# Altium project 60ghz radar pcb.PrjPcb
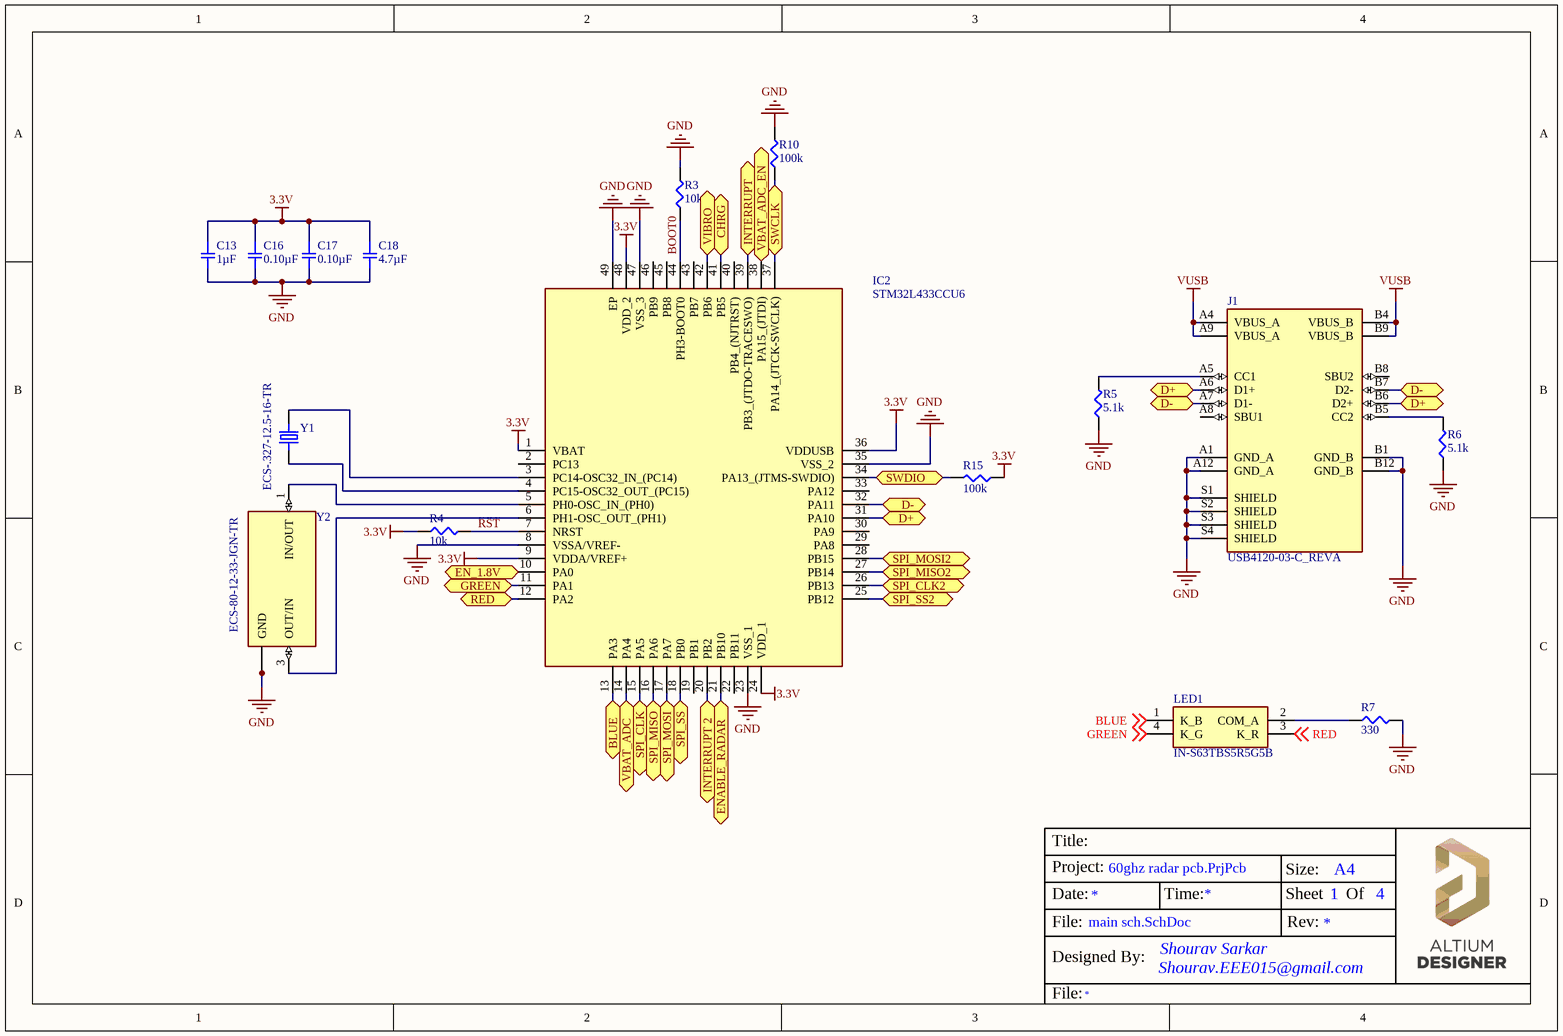
[diagram p0: main sch.SchDoc]
4 sheets, 51 parts. Net scope: flat (ports and power ports of the same name join across sheets).
Board file: 60ghz radar pcb.PcbDoc
Sheets:
  main sch.SchDoc
  power schematic.SchDoc
  radar sch.SchDoc
  battery check and motor.SchDoc

## Sheet main sch.SchDoc
size A4; SheetNumber: 1; SheetTotal: 4

### Parts
C13  1µF  [SMD-0402C]
C16  0.10µF  [SMD-0402C]
C17  0.10µF  [SMD-0402C]
C18  4.7µF  [SMD-0402C]
IC2  STM32L433CCU6  [QFN50P700X700X60-49N-D]
J1  USB4120-03-C_REVA  [GCT_USB4120-03-C_REVA]
LED1  IN-S63TBS5R5G5B  [INS63TBS5R5G5B]
R3  10k  [SMD-0402-RES]
R4  10k  [SMD-0402-RES]
R5  5.1k  [SMD-0402-RES]
R6  5.1k  [SMD-0402-RES]
R7  330  [SMD-0402-RES]
R10  100k  [SMD-0402-RES]
R15  100k  [SMD-0402-RES]
Y1  ECS-.327-12.5-16-TR  [XTAL_ECS-.327-12.5-16-TR]
Y2  ECS-80-12-33-JGN-TR  [XTAL_ECS-240-8-33-AGN-TR]

### Ports
BLUE (bidir), CHRG (bidir), D+ (bidir), D- (bidir), EN_1.8V (bidir), ENABLE_RADAR (bidir), GREEN (bidir), INTERRUPT 2 (bidir), INTERRUPT (bidir), RED (bidir), SPI_CLK2 (bidir), SPI_CLK (bidir), SPI_MISO2 (bidir), SPI_MISO (bidir), SPI_MOSI2 (bidir), SPI_MOSI (bidir), SPI_SS2 (bidir), SPI_SS (bidir), SWCLK (bidir), SWDIO (bidir), VBAT_ADC (bidir), VBAT_ADC_EN (bidir), VIBRO (bidir)

### Nets
3.3V: C13.1 C16.1 C17.1 C18.1 IC2.1(VBAT) IC2.9(VDDA/VREF+) IC2.24(VDD_1) IC2.36(VDDUSB) IC2.48(VDD_2) R4.1 R15.1
GND: C13.2 C16.2 C17.2 C18.2 IC2.8(VSSA/VREF-) IC2.23(VSS_1) IC2.35(VSS_2) IC2.47(VSS_3) IC2.49(EP) J1.A1(GND_A) J1.A12(GND_A) J1.B1(GND_B) J1.B12(GND_B) J1.S1(SHIELD) J1.S2(SHIELD) J1.S3(SHIELD) J1.S4(SHIELD) R3.2 R5.1 R6.1 R7.2 R10.2 Y2.2(GND) Y2.4(GND)
VUSB: J1.A4(VBUS_A) J1.A9(VBUS_A) J1.B4(VBUS_B) J1.B9(VBUS_B)
BLUE: IC2.13(PA3) ; port BLUE
BLUE: LED1.1(K_B) ; off-sheet BLUE  [a separate net that carries the same name]
BOOT0: IC2.44(PH3-BOOT0) R3.1
CHRG: IC2.41(PB5) ; port CHRG
D+: IC2.31(PA10) J1.A6(D1+) J1.B6(D2+) ; port D+
D-: IC2.32(PA11) J1.A7(D1-) J1.B7(D2-) ; port D-
EN_1.8V: IC2.10(PA0) ; port EN_1.8V
ENABLE_RADAR: IC2.21(PB10) ; port ENABLE_RADAR
GREEN: IC2.11(PA1) ; port GREEN
GREEN: LED1.4(K_G) ; off-sheet GREEN  [a separate net that carries the same name]
INTERRUPT: IC2.39(PB3_(JTDO-TRACESWO)) ; port INTERRUPT
INTERRUPT 2: IC2.20(PB2) ; port INTERRUPT 2
RED: IC2.12(PA2) ; port RED
RED: LED1.3(K_R) ; off-sheet RED  [a separate net that carries the same name]
RST: IC2.7(NRST) R4.2
SPI_CLK: IC2.15(PA5) ; port SPI_CLK
SPI_CLK2: IC2.26(PB13) ; port SPI_CLK2
SPI_MISO: IC2.16(PA6) ; port SPI_MISO
SPI_MISO2: IC2.27(PB14) ; port SPI_MISO2
SPI_MOSI: IC2.17(PA7) ; port SPI_MOSI
SPI_MOSI2: IC2.28(PB15) ; port SPI_MOSI2
SPI_SS: IC2.18(PB0) ; port SPI_SS
SPI_SS2: IC2.25(PB12) ; port SPI_SS2
SWCLK: IC2.37(PA14_(JTCK-SWCLK)) R10.1 ; port SWCLK
SWDIO: IC2.34(PA13_(JTMS-SWDIO)) R15.2 ; port SWDIO
VBAT_ADC: IC2.14(PA4) ; port VBAT_ADC
VIBRO: IC2.42(PB6) ; port VIBRO
NetIC2_3: IC2.3(PC14-OSC32_IN_(PC14)) Y1.1
NetIC2_4: IC2.4(PC15-OSC32_OUT_(PC15)) Y1.2
NetIC2_5: IC2.5(PH0-OSC_IN_(PH0)) Y2.1(IN/OUT)
NetIC2_6: IC2.6(PH1-OSC_OUT_(PH1)) Y2.3(OUT/IN)
NetJ1_A5: J1.A5(CC1) R5.2
NetJ1_B5: J1.B5(CC2) R6.2
NetLED1_2: LED1.2(COM_A) R7.1

Not connected (* = marked no-connect by the designer): IC2 2(PC13) 19(PB1) 22(PB11) 29(PA8) 30(PA9) 33(PA12) 38(PA15_(JTDI)) 40(PB4_(NJTRST)) 43(PB7) 45(PB8) 46(PB9); J1 A8(SBU1) B8(SBU2)

### Notes on the sheet
- Title:
- Project:
- Date:
- Time:
- Sheet
- Size:
- A4
- Of
- Designed By:
- File:
- Shourav.EEE015@gmail.com
- Shourav Sarkar
- Rev:

### Library data of the parts
C13 = GCM155C71A105KE38D: CAP CER 1UF 10V X7S 0402; Manufacturer: Murata Electronics North America; Factory Stock: 0; Unit Price (USD): 0.12; Minimum Quantity: 1; Tolerance: ±10%; Datasheets: http://www.murata.com/~/media/webrenewal/support/library/catalog/products/capacitor/mlcc/c03e.ashx; Image: //media.digikey.com/Renders/Murata%20Renders/ZRB-SERIES-0402.jpg; Digi-Key Part Number: 490-13409-1-ND; Part Number: GCM155C71A105KE38D; Quantity Available: 7240; @ qty: 0; Packaging: Cut Tape (CT); Series: GCM; Part Status: Active; Value: 1µF; Voltage: 10V; Temperature Coefficient: X7S; Operating Temperature: -55°C ~ 125°C; Features: -; Ratings: AEC-Q200; Applications: Automotive; Mounting Type: Surface Mount, MLCC; Package / Case: 0402 (1005 Metric); Size / Dimension: 0.039" L x 0.020" W (1.00mm x 0.50mm); Height - Seated (Max): -; Thickness (Max): 0.022" (0.55mm); Lead Spacing: -; Lead Style: -
C16 C17 = GCM155R71C104KA55D: CAP CER 0.1UF 16V X7R 0402; Manufacturer: Murata Electronics North America; Factory Stock: 0; Unit Price (USD): 0.1; Minimum Quantity: 1; Tolerance: ±10%; Datasheets: http://www.murata.com/~/media/webrenewal/support/library/catalog/products/capacitor/mlcc/c03e.ashx; Image: //media.digikey.com/Renders/Murata%20Renders/ZRB-SERIES-0402.jpg; Digi-Key Part Number: 490-4759-1-ND; Part Number: GCM155R71C104KA55D; Quantity Available: 734194; @ qty: 0; Packaging: Cut Tape (CT); Series: GCM; Part Status: Active; Value: 0.10µF; Voltage: 16V; Temperature Coefficient: X7R; Operating Temperature: -55°C ~ 125°C; Features: -; Ratings: AEC-Q200; Applications: Automotive; Mounting Type: Surface Mount, MLCC; Package / Case: 0402 (1005 Metric); Size / Dimension: 0.039" L x 0.020" W (1.00mm x 0.50mm); Height - Seated (Max): -; Thickness (Max): 0.022" (0.55mm); Lead Spacing: -; Lead Style: -
C18 = GRM153R60J475ME15D: CAP CER 4.7UF 6.3V X5R 0402; Manufacturer: Murata Electronics North America; Factory Stock: 0; Unit Price (USD): 0.27; Minimum Quantity: 1; Tolerance: ±20%; Datasheets: http://psearch.en.murata.com/capacitor/product/GRM153R60J475ME15%23.pdf; Image: //media.digikey.com/Renders/Murata%20Renders/ZRB-SERIES-0402.jpg; Digi-Key Part Number: 490-13232-1-ND; Part Number: GRM153R60J475ME15D; Quantity Available: 30412; @ qty: 0; Packaging: Cut Tape (CT); Series: GRM; Part Status: Active; Value: 4.7µF; Voltage: 6.3V; Temperature Coefficient: X5R; Operating Temperature: -55°C ~ 85°C; Features: Derating Recommended; Ratings: -; Applications: General Purpose; Mounting Type: Surface Mount, MLCC; Package / Case: 0402 (1005 Metric); Size / Dimension: 0.039" L x 0.020" W (1.00mm x 0.50mm); Height - Seated (Max): -; Thickness (Max): 0.013" (0.33mm); Lead Spacing: -; Lead Style: -
IC2 = STM32L433CCU6: Integrated Circuit; Manufacturer_Name: STMicroelectronics; Datasheet Link: http://www.st.com/content/ccc/resource/technical/document/datasheet/f7/a0/fc/27/24/4e/4f/3f/DM00257192.pdf/files/DM00257192.pdf/jcr:content/translations/en.DM00257192.pdf; Height: 0.6mm; Manufacturer_Part_Number: STM32L433CCU6; Mouser Part Number: 511-STM32L433CCU6; Mouser Price/Stock: https://www.mouser.co.uk/ProductDetail/STMicroelectronics/STM32L433CCU6?qs=dTJS0cRn7oiKq9T6SJeUpg%3D%3D; Arrow Part Number: STM32L433CCU6; Arrow Price/Stock: https://www.arrow.com/en/products/stm32l433ccu6/stmicroelectronics?region=nac
J1 = USB4120-03-C_REVA: MF: {'manufacturer': u'Global Connector Technology'}; Package: None; Price: None; Value: *; MP: USB4120-03-C_REVA; Availability: Unavailable
LED1 = IN-S63TBS5R5G5B: LED; Manufacturer_Name: Inolux; Datasheet Link: http://www.inolux-corp.com/datasheet/SMDLED/RGB%20Side%20View/IN-S63TBS5R5G5B_V1.0.pdf; Height: 0.6mm; Manufacturer_Part_Number: IN-S63TBS5R5G5B; Mouser Part Number: 743-IN-S63TBS5R5G5B; Mouser Price/Stock: https://www.mouser.co.uk/ProductDetail/Inolux/IN-S63TBS5R5G5B?qs=stqOd1AaK7%2Fi2QYkhDu%252BwA%3D%3D; Arrow Part Number: IN-S63TBS5R5G5B; Arrow Price/Stock: https://www.arrow.com/en/products/in-s63tbs5r5g5b/inolux-corporation?region=nac
R3 R4 = ERJ-2GEJ103X: RES SMD 10K OHM 5% 1/10W 0402; Manufacturer: Panasonic Electronic Components; Factory Stock: 0; Unit Price (USD): 0.00350; @ qty: 1500; Minimum Quantity: 1; Power (Watts): 0.1W, 1/10W; Temperature Coefficient: ±200ppm/°C; Part Number: ERJ-2GEJ103X; Datasheets: http://industrial.panasonic.com/www-cgi/jvcr13pz.cgi?E+PZ+3+AOA0001+ERJ2GEJ103X+7+WW; Image: //media.digikey.com/Photos/Panasonic%20Photos/ERJ-PA2-Series.jpg; Digi-Key Part Number: P10KJCT-ND; Quantity Available: 2560215; Packaging: Cut Tape (CT); Series: ERJ; Part Status: Active; Value: 10k; Tolerance: ±5%; Composition: Thick Film; Features: Automotive AEC-Q200; Operating Temperature: -55°C ~ 155°C; Package / Case: 0402 (1005 Metric); Supplier Device Package: 0402; Size / Dimension: 0.039" L x 0.020" W (1.00mm x 0.50mm); Height - Seated (Max): 0.016" (0.40mm); Number of Terminations: 2; Failure Rate: -
R5 R6 = ERJ-2GEJ512X: RES SMD 5.1K OHM 5% 1/10W 0402; Manufacturer: Panasonic Electronic Components; Factory Stock: 0; Unit Price (USD): 0.00350; @ qty: 1500; Minimum Quantity: 1; Power (Watts): 0.1W, 1/10W; Temperature Coefficient: ±200ppm/°C; Part Number: ERJ-2GEJ512X; Datasheets: http://industrial.panasonic.com/www-cgi/jvcr13pz.cgi?E+PZ+3+AOA0001+ERJ2GEJ512X+7+WW; Image: //media.digikey.com/Photos/Panasonic%20Photos/ERJ-PA2-Series.jpg; Digi-Key Part Number: P5.1KJCT-ND; Quantity Available: 153265; Packaging: Cut Tape (CT); Series: ERJ; Part Status: Active; Value: 5.1k; Tolerance: ±5%; Composition: Thick Film; Features: Automotive AEC-Q200; Operating Temperature: -55°C ~ 155°C; Package / Case: 0402 (1005 Metric); Supplier Device Package: 0402; Size / Dimension: 0.039" L x 0.020" W (1.00mm x 0.50mm); Height - Seated (Max): 0.016" (0.40mm); Number of Terminations: 2; Failure Rate: -
R7 = ERJ-2RKF3300X: RES SMD 330 OHM 1% 1/10W 0402; Manufacturer: Panasonic Electronic Components; Factory Stock: 0; Unit Price (USD): 0.00496; @ qty: 1500; Minimum Quantity: 1; Power (Watts): 0.1W, 1/10W; Temperature Coefficient: ±100ppm/°C; Part Number: ERJ-2RKF3300X; Datasheets: http://industrial.panasonic.com/www-cgi/jvcr13pz.cgi?E+PZ+3+AOA0002+ERJ2RKF3300X+7+WW; Image: //media.digikey.com/Photos/Panasonic%20Photos/ERJ-PA2-Series.jpg; Digi-Key Part Number: P330LCT-ND; Quantity Available: 537077; Packaging: Cut Tape (CT); Series: ERJ; Part Status: Active; Value: 330; Tolerance: ±1%; Composition: Thick Film; Features: Automotive AEC-Q200; Operating Temperature: -55°C ~ 155°C; Package / Case: 0402 (1005 Metric); Supplier Device Package: 0402; Size / Dimension: 0.039" L x 0.020" W (1.00mm x 0.50mm); Height - Seated (Max): 0.016" (0.40mm); Number of Terminations: 2; Failure Rate: -
R10 R15 = ERJ-2GEJ104X: RES SMD 100K OHM 5% 1/10W 0402; Manufacturer: Panasonic Electronic Components; Factory Stock: 0; Unit Price (USD): 0.00350; @ qty: 1500; Minimum Quantity: 1; Power (Watts): 0.1W, 1/10W; Temperature Coefficient: ±200ppm/°C; Part Number: ERJ-2GEJ104X; Datasheets: http://industrial.panasonic.com/www-cgi/jvcr13pz.cgi?E+PZ+3+AOA0001+ERJ2GEJ104X+7+WW; Image: //media.digikey.com/Photos/Panasonic%20Photos/ERJ-PA2-Series.jpg; Digi-Key Part Number: P100KJCT-ND; Quantity Available: 2387986; Packaging: Cut Tape (CT); Series: ERJ; Part Status: Active; Value: 100k; Tolerance: ±5%; Composition: Thick Film; Features: Automotive AEC-Q200; Operating Temperature: -55°C ~ 155°C; Package / Case: 0402 (1005 Metric); Supplier Device Package: 0402; Size / Dimension: 0.039" L x 0.020" W (1.00mm x 0.50mm); Height - Seated (Max): 0.016" (0.40mm); Number of Terminations: 2; Failure Rate: -
Y1 = ECS-.327-12.5-16-TR: SMD Tuning Fork Crystal; MF: {'manufacturer': u'ECS Inc.'}; Package: None; Price: None; Value: *; MP: ECS-.327-12.5-16-TR; Availability: Unavailable
Y2 = ECS-80-12-33-JGN-TR: The sub miniature ECX-32 is a compact SMD Crystal. The 3.2 x 2.5 x 0.8 mm ceramic package is ideal for todayâ€™s SMD manufacturing environment.; MF: {'manufacturer': u'ECS Inc.'}; Package: None; Price: None; Value: *; MP: ECS-80-12-33-JGN-TR; Availability: Unavailable

## Sheet power schematic.SchDoc
size A4; SheetNumber: 2; SheetTotal: 4
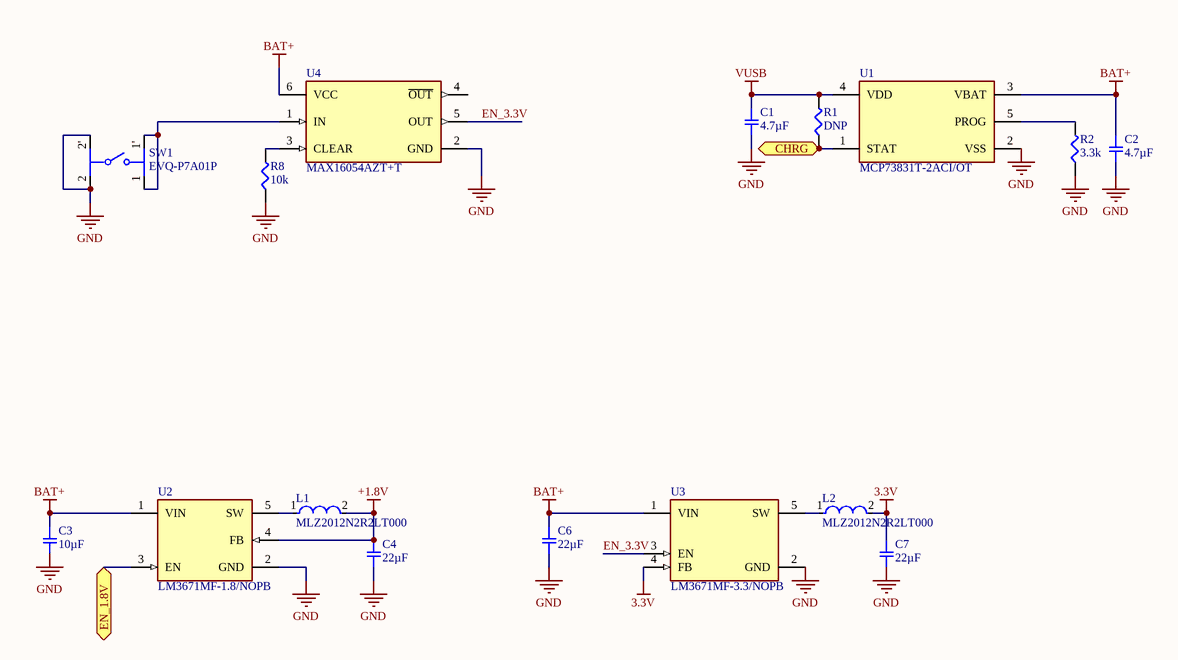
[diagram p1: power schematic.SchDoc]

### Parts
C1  4.7µF  [SMD-0402C]
C2  4.7µF  [SMD-0402C]
C3  10µF  [SMD-0402C]
C4  22µF  [SMD-0603C]
C6  22µF  [SMD-0603C]
C7  22µF  [SMD-0603C]
L1  MLZ2012N2R2LT000  [FP-MLZ2012-0_85-IPC_A]
L2  MLZ2012N2R2LT000  [FP-MLZ2012-0_85-IPC_A]
R1  DNP  [SMD-0402-RES]
R2  3.3k  [SMD-0402-RES]
R8  10k  [SMD-0402-RES]
SW1  EVQ-P7A01P  [FP-EVQ-P7A01P-MFG]
U1  MCP73831T-2ACI/OT  [FP-C04-091-OT-IPC_B]
U2  LM3671MF-1.8/NOPB  [FP-DBV0005A-IPC_A]
U3  LM3671MF-3.3/NOPB  [FP-DBV0005A-IPC_C]
U4  MAX16054AZT+T  [FP-Z6-1-IPC_A]

### Ports
CHRG (bidir), EN_1.8V (bidir)

### Nets
3.3V: C7.1 L2.2 U3.4(FB)
+1.8V: C4.1 L1.2 U2.4(FB)
BAT+: C2.1 C3.1 C6.1 U1.3(VBAT) U2.1(VIN) U3.1(VIN) U4.6(VCC)
GND: C1.2 C2.2 C3.2 C4.2 C6.2 C7.2 R2.1 R8.1 SW1.2 SW1.2' U1.2(VSS) U2.2(GND) U3.2(GND) U4.2(GND)
VUSB: C1.1 R1.2 U1.4(VDD)
CHRG: R1.1 U1.1(STAT) ; port CHRG
EN_1.8V: U2.3(EN) ; port EN_1.8V
EN_3.3V: U3.3(EN) U4.5(OUT)
NetL1_1: L1.1 U2.5(SW)
NetL2_1: L2.1 U3.5(SW)
NetR2_2: R2.2 U1.5(PROG)
NetR8_2: R8.2 U4.3(CLEAR)
NetSW1_1: SW1.1 SW1.1' U4.1(IN)

Not connected (* = marked no-connect by the designer): U4 4(~{OUT})

### Notes on the sheet
- Title:
- Project:
- Date:
- Time:
- Sheet
- Size:
- A4
- Of
- Designed By:
- File:
- Shourav.EEE015@gmail.com
- Shourav Sarkar
- Rev:

### Library data of the parts
C1 C2 = ZRB15XR61A475KE01D: CAP CER 4.7UF 10V X5R 0402; Manufacturer: Murata Electronics North America; Factory Stock: 0; Unit Price (USD): 0.28; Minimum Quantity: 1; Tolerance: ±10%; Datasheets: http://search.murata.co.jp/Ceramy/image/img/A01X/G101/ENG/ZRB15XR61A475KE01-01.pdf; Image: //media.digikey.com/Renders/Murata%20Renders/ZRB-SERIES-0402.jpg; Digi-Key Part Number: 490-13252-1-ND; Part Number: ZRB15XR61A475KE01D; Quantity Available: 23076; @ qty: 0; Packaging: Cut Tape (CT); Series: ZRB; Part Status: Active; Value: 4.7µF; Voltage: 10V; Temperature Coefficient: X5R; Operating Temperature: -55°C ~ 85°C; Features: Derating Recommended, Interposer Termination; Ratings: -; Applications: Acoustic Noise Reduction; Mounting Type: Surface Mount, MLCC; Package / Case: 0402 (1005 Metric); Size / Dimension: 0.039" L x 0.020" W (1.00mm x 0.50mm); Height - Seated (Max): -; Thickness (Max): 0.031" (0.80mm); Lead Spacing: -; Lead Style: -
C3 = GRJ155R60J106ME11D: CAP CER 10UF 6.3V X5R 0402; Manufacturer: Murata Electronics North America; Factory Stock: 0; Unit Price (USD): 0.23; Minimum Quantity: 1; Tolerance: ±20%; Datasheets: http://psearch.en.murata.com/capacitor/product/GRJ155R60J106ME11%23.pdf; Image: //media.digikey.com/Renders/Murata%20Renders/ZRB-SERIES-0402.jpg; Digi-Key Part Number: 490-13211-1-ND; Part Number: GRJ155R60J106ME11D; Quantity Available: 64064; @ qty: 0; Packaging: Cut Tape (CT); Series: GRJ; Part Status: Active; Value: 10µF; Voltage: 6.3V; Temperature Coefficient: X5R; Operating Temperature: -55°C ~ 85°C; Features: Derating Recommended, Soft Termination; Ratings: -; Applications: Boardflex Sensitive; Mounting Type: Surface Mount, MLCC; Package / Case: 0402 (1005 Metric); Size / Dimension: 0.039" L x 0.020" W (1.00mm x 0.50mm); Height - Seated (Max): -; Thickness (Max): 0.028" (0.70mm); Lead Spacing: -; Lead Style: -
C4 C6 C7 = GRM186R60J226ME15D: CAP CER 22UF 6.3V X5R 0603; Manufacturer: Murata Electronics North America; Factory Stock: 0; Unit Price (USD): 0.32; Minimum Quantity: 1; Tolerance: ±20%; Datasheets: http://psearch.en.murata.com/capacitor/product/GRM186R60J226ME15%23.pdf; Image: //media.digikey.com/Renders/Murata%20Renders/ZRB-SERIES-0402.jpg; Digi-Key Part Number: 490-13241-1-ND; Part Number: GRM186R60J226ME15D; Quantity Available: 5072; @ qty: 0; Packaging: Cut Tape (CT); Series: GRM; Part Status: Active; Value: 22µF; Voltage: 6.3V; Temperature Coefficient: X5R; Operating Temperature: -55°C ~ 85°C; Features: Derating Recommended; Ratings: -; Applications: General Purpose; Mounting Type: Surface Mount, MLCC; Package / Case: 0603 (1608 Metric); Size / Dimension: 0.063" L x 0.031" W (1.60mm x 0.80mm); Height - Seated (Max): -; Thickness (Max): 0.028" (0.70mm); Lead Spacing: -; Lead Style: -
L1 L2 = CMP-08253-000395-1: Shielded Multilayer Inductor 2.2uH ±20% 800mA 156mΩ SMD 0805; Core Material: Ferrite; Test Frequency: 2MHz; Self Resonant Frequency: 120MHz; Saturation Current: 170mA; DC Resistance (DCR): 156mR; Mount: Surface Mount; Tolerance: 20%; Length: 0.079inch; Packaging: Tape and Reel; Inductance: 2.2uH; Current Rating: 800mA; Min Operating Temperature: -55°C; Case Code (Metric): 2012; Shielding: Shielded; Max Operating Temperature: 125°C; Width: 0.049inch; Case/Package: 0805; RoHS Compliant: Yes; Height - Seated (Max): 0.041inch; Package Quantity: 1; Case Code (Imperial): 0805
R1 R8 = ERJ-2GEJ103X: as R3 on sheet main sch; Part Number: ERJ-2GEJ103X; Datasheets: http://industrial.panasonic.com/www-cgi/jvcr13pz.cgi?E+PZ+3+AOA0001+ERJ2GEJ103X+7+WW; Image: //media.digikey.com/Photos/Panasonic%20Photos/ERJ-PA2-Series.jpg; Digi-Key Part Number: P10KJCT-ND; Quantity Available: 2560215; Packaging: Cut Tape (CT); Series: ERJ; Part Status: Active; Value: 10k; Tolerance: ±5%; Composition: Thick Film; Features: Automotive AEC-Q200; Operating Temperature: -55°C ~ 155°C; Package / Case: 0402 (1005 Metric); Supplier Device Package: 0402; Size / Dimension: 0.039" L x 0.020" W (1.00mm x 0.50mm); Height - Seated (Max): 0.016" (0.40mm); Number of Terminations: 2; Failure Rate: -
R2 = ERJ-2GEJ332X: RES SMD 3.3K OHM 5% 1/10W 0402; Manufacturer: Panasonic Electronic Components; Factory Stock: 0; Unit Price (USD): 0.00350; @ qty: 1500; Minimum Quantity: 1; Power (Watts): 0.1W, 1/10W; Temperature Coefficient: ±200ppm/°C; Part Number: ERJ-2GEJ332X; Datasheets: http://industrial.panasonic.com/www-cgi/jvcr13pz.cgi?E+PZ+3+AOA0001+ERJ2GEJ332X+7+WW; Image: //media.digikey.com/Photos/Panasonic%20Photos/ERJ-PA2-Series.jpg; Digi-Key Part Number: P3.3KJCT-ND; Quantity Available: 514266; Packaging: Cut Tape (CT); Series: ERJ; Part Status: Active; Value: 3.3k; Tolerance: ±5%; Composition: Thick Film; Features: Automotive AEC-Q200; Operating Temperature: -55°C ~ 155°C; Package / Case: 0402 (1005 Metric); Supplier Device Package: 0402; Size / Dimension: 0.039" L x 0.020" W (1.00mm x 0.50mm); Height - Seated (Max): 0.016" (0.40mm); Number of Terminations: 2; Failure Rate: -
SW1 = CMP-05618-000007-1: SWITCH TACTILE SPST-NO 0.05A 12V; Manufacturer: Panasonic; Operating Force: 2.2N; Contact Resistance: 500mΩ; Contact Current Rating: 50mA; Electromechanical Life: 100000Cycles; Device Class L2: Switches; Lead Free: Yes; Mount: Surface Mount; Digikey Description: SWITCH TACTILE SPST-NO 0.05A 12V; Temperature Range High: +70°C; Device Class L3: Tactile Switches; Package: EVQ-P7A01P; Voltage Rating Dc: 12V; Octopart: https://octopart.com/evq-p7a01p-panasonic-29917075; ComponentLink2URL: https://industrial.panasonic.com/cdbs/www-data/pdf/ATK0000/ATK0000C378.pdf; Automotive: No; Device Class L1: Electromechanical; Mouser Description: SWITCH TACTILE SPST-NO 0.05A 12V; Temperature: -20°C to +70°C; Manufacturer Part Number: EVQ-P7A01P; ComponentLink2Description: Datasheet; RoHS: TRUE; Category: Switch; Temperature Range Low: -20°C; Throw Configuration: SPST-NO; Height: 1.55mm
U1 = CMP-0133-00143-2: IC CONTROLLR LI-ION 4.2V SOT23-5; Max Power Dissipation: 1.54W; Output Current: 500mA; Max Output Voltage: 4.5V; Number of Outputs: 1; Min Output Voltage: 4.168V; Min Supply Voltage: 3.75V; Max Input Voltage: 6V; Voltage Rating: 4.534V; Drain to Source Resistance: 350mR; Max Operating Temperature: 85°C; Length: 0.122inch; Number of Pins: 5; REACH SVHC: No SVHC; Radiation Hardening: No; Min Operating Temperature: -40°C; Weight: 0.00709oz; Contact Plating: Tin; Termination: SMD/SMT; Case/Package: SOT-23; Mount: Surface Mount; Width: 0.071inch; Packaging: Tape and Reel; Number of Cells: 1; Max Charge Current: 500mA; Height: 0.051inch; Number of Channels: 1; Output Voltage: 4.2V; Max Supply Voltage: 6V; Lead Free: Lead Free
U2 = CMP-0063-00882-4: IC REG BUCK 1.8V 600MA SOT23-5; Efficiency: 93%; Switching Frequency: 2.6MHz; Max Supply Voltage: 5.5V; Frequency: 2MHz; Output Type: Fixed; Min Output Voltage: 1.1V; Min Input Voltage: 2.7V; Synchronous Rectifier: Yes; Quiescent Current: 16uA; Number of Outputs: 1; Contact Plating: Tin; Max Output Voltage: 1.8V; Output Voltage: 1.8V; Termination: SMD/SMT; Mount: Surface Mount; Series: LM3671; Length: 2.92mm; Case/Package: SOT-23; Max Operating Temperature: 85°C; Nominal Output Voltage: 1.8V; Radiation Hardening: No; Package Quantity: 1000; Width: 1.6mm; REACH SVHC: No SVHC; Height: 1.02mm; Max Input Voltage: 5.5V; Lead Free: Lead Free; Output Current: 600mA; Packaging: Tape and Reel; Number of Pins: 5; RoHS Compliant: Yes; Min Operating Temperature: -40°C; Max Output Current: 600mA; Min Supply Voltage: 2.7V
U3 = CMP-0063-01132-4: IC REG BUCK 3.3V 600MA SOT23-5; Number of Outputs: 1; Min Supply Voltage: 2.7V; Frequency: 2MHz; Min Output Voltage: 1.1V; Max Supply Voltage: 5.5V; Output Type: Fixed; Switching Frequency: 2.6MHz; Quiescent Current: 16uA; Case/Package: SOT-23; Number of Pins: 5; Lead Free: Lead Free; Min Operating Temperature: -40°C; Length: 2.92mm; Packaging: Tape and Reel; Max Output Current: 600mA; Height: 1.02mm; Max Operating Temperature: 85°C; Mount: Surface Mount; REACH SVHC: No SVHC; Contact Plating: Tin; Output Current: 600mA; Min Input Voltage: 2.7V; RoHS Compliant: Yes; Output Voltage: 3.3V; Package Quantity: 1000; Max Output Voltage: 3.3V; Nominal Output Voltage: 3.3V; Width: 1.6mm; Max Input Voltage: 5.5V; Termination: SMD/SMT
U4 = CMP-0251-00627-2: IC INTFACE SPECIALIZED TSOT23-6; Undervoltage Threshold: 1.8V; Max Supply Voltage: 5.5V; Min Supply Voltage: 2.7V; Max Power Dissipation: 727W; Number of Voltages Monitored: 1; Watchdog Timer: No; Operating Supply Current: 7uA; Output Type: PUSH-PULL; RoHS Compliant: Yes; Series: -; Contact Plating: Tin; Length: 4mm; Height: 0.73mm; Radiation Hardening: No; Number of Pins: 6; Min Operating Temperature: -40°C; Width: 4mm; Mount: Surface Mount; Package Quantity: 1; Max Operating Temperature: 125°C; Packaging: Tape and Reel; Case/Package: SOT-23-6

## Sheet radar sch.SchDoc
size A4; SheetNumber: 3; SheetTotal: 4
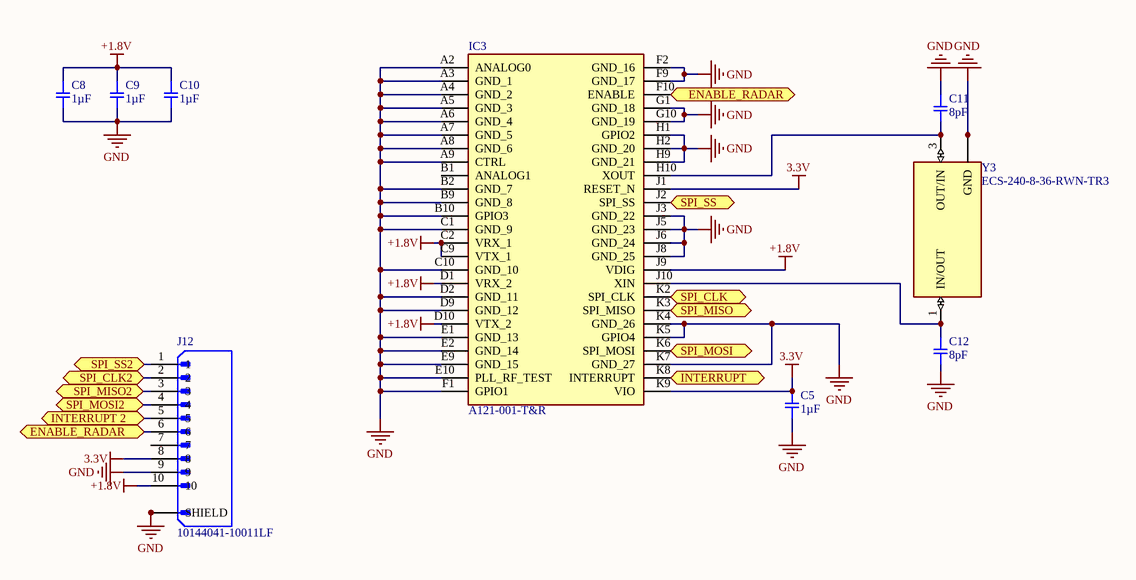
[diagram p2: radar sch.SchDoc]

### Parts
C5  1µF  [SMD-0402C]
C8  1µF  [SMD-0402C]
C9  1µF  [SMD-0402C]
C10  1µF  [SMD-0402C]
C11  8pF  [SMD-0402C]
C12  8pF  [SMD-0402C]
IC3  A121-001-T&R  [A121001TR]
J12  10144041-10011LF  [AMPHENOL_10144041-10011LF]
Y3  ECS-240-8-36-RWN-TR3  [XTAL_ECS-240-8-36-RWN-TR3]

### Ports
ENABLE_RADAR (bidir), INTERRUPT 2 (bidir), INTERRUPT (bidir), SPI_CLK2 (bidir), SPI_CLK (bidir), SPI_MISO2 (bidir), SPI_MISO (bidir), SPI_MOSI2 (bidir), SPI_MOSI (bidir), SPI_SS2 (bidir), SPI_SS (bidir)

### Nets
3.3V: C5.1 IC3.J1(RESET_N) IC3.K9(VIO) J12.8
+1.8V: C8.1 C9.1 C10.1 IC3.C2(VRX_1) IC3.C9(VTX_1) IC3.D1(VRX_2) IC3.D10(VTX_2) IC3.J9(VDIG) J12.10
GND: C5.2 C8.2 C9.2 C10.2 C11.1 C12.2 IC3.A2(ANALOG0) IC3.A3(GND_1) IC3.A4(GND_2) IC3.A5(GND_3) IC3.A6(GND_4) IC3.A7(GND_5) IC3.A8(GND_6) IC3.A9(CTRL) IC3.B2(GND_7) IC3.B9(GND_8) IC3.B10(GPIO3) IC3.C1(GND_9) IC3.C10(GND_10) IC3.D2(GND_11) IC3.D9(GND_12) IC3.E1(GND_13) IC3.E2(GND_14) IC3.E9(GND_15) IC3.E10(PLL_RF_TEST) IC3.F1(GPIO1) IC3.F2(GND_16) IC3.F9(GND_17) IC3.G1(GND_18) IC3.G10(GND_19) IC3.H1(GPIO2) IC3.H2(GND_20) IC3.H9(GND_21) IC3.J3(GND_22) IC3.J5(GND_23) IC3.J6(GND_24) IC3.J8(GND_25) IC3.K4(GND_26) IC3.K5(GPIO4) IC3.K7(GND_27) J12.9 J12.S1(SHIELD) J12.S2(SHIELD) Y3.2(GND) Y3.4(GND)
ENABLE_RADAR: IC3.F10(ENABLE) J12.6 ; port ENABLE_RADAR
INTERRUPT: IC3.K8(INTERRUPT) ; port INTERRUPT
INTERRUPT 2: J12.5 ; port INTERRUPT 2
SPI_CLK: IC3.K2(SPI_CLK) ; port SPI_CLK
SPI_CLK2: J12.2 ; port SPI_CLK2
SPI_MISO: IC3.K3(SPI_MISO) ; port SPI_MISO
SPI_MISO2: J12.3 ; port SPI_MISO2
SPI_MOSI: IC3.K6(SPI_MOSI) ; port SPI_MOSI
SPI_MOSI2: J12.4 ; port SPI_MOSI2
SPI_SS: IC3.J2(SPI_SS) ; port SPI_SS
SPI_SS2: J12.1 ; port SPI_SS2
NetC11_2: C11.2 IC3.H10(XOUT) Y3.3(OUT/IN)
NetC12_1: C12.1 IC3.J10(XIN) Y3.1(IN/OUT)

Not connected (* = marked no-connect by the designer): IC3 B1(ANALOG1); J12 7

### Notes on the sheet
- Title:
- Project:
- Date:
- Time:
- Sheet
- Size:
- A4
- Of
- Designed By:
- File:
- Shourav.EEE015@gmail.com
- Shourav Sarkar
- Rev:

### Library data of the parts
C5 C8-C10 = GCM155C71A105KE38D: as C13 on sheet main sch; Datasheets: http://www.murata.com/~/media/webrenewal/support/library/catalog/products/capacitor/mlcc/c03e.ashx; Image: //media.digikey.com/Renders/Murata%20Renders/ZRB-SERIES-0402.jpg; Digi-Key Part Number: 490-13409-1-ND; Part Number: GCM155C71A105KE38D; Quantity Available: 7240; @ qty: 0; Packaging: Cut Tape (CT); Series: GCM; Part Status: Active; Value: 1µF; Voltage: 10V; Temperature Coefficient: X7S; Operating Temperature: -55°C ~ 125°C; Features: -; Ratings: AEC-Q200; Applications: Automotive; Mounting Type: Surface Mount, MLCC; Package / Case: 0402 (1005 Metric); Size / Dimension: 0.039" L x 0.020" W (1.00mm x 0.50mm); Height - Seated (Max): -; Thickness (Max): 0.022" (0.55mm); Lead Spacing: -; Lead Style: -
C11 C12 = GRM1555C1H8R0BA01D: CAP CER 8PF 50V NP0 0402; Manufacturer: Murata Electronics North America; Factory Stock: 0; Unit Price (USD): 0.1; Minimum Quantity: 1; Tolerance: ±0.1pF; Temperature Coefficient: C0G, NP0; Datasheets: http://www.murata.com/~/media/webrenewal/support/library/catalog/products/capacitor/mlcc/c02e.pdf; Image: //media.digikey.com/Renders/Murata%20Renders/ZRB-SERIES-0402.jpg; Digi-Key Part Number: 490-8230-1-ND; Part Number: GRM1555C1H8R0BA01D; Quantity Available: 3665; @ qty: 0; Packaging: Cut Tape (CT); Series: GRM; Part Status: Active; Value: 8pF; Voltage: 50V; Operating Temperature: -55°C ~ 125°C; Features: -; Ratings: -; Applications: General Purpose; Mounting Type: Surface Mount, MLCC; Package / Case: 0402 (1005 Metric); Size / Dimension: 0.039" L x 0.020" W (1.00mm x 0.50mm); Height - Seated (Max): -; Thickness (Max): 0.022" (0.55mm); Lead Spacing: -; Lead Style: -
IC3 = A121-001-T&R: Integrated Circuit; Manufacturer_Name: Acconeer AB; Datasheet Link: https://gr.mouser.com/datasheet/2/1126/A121_datasheet-3133196.pdf; Height: 0.899mm; Manufacturer_Part_Number: A121-001-T&R; Mouser Part Number: 925-A121-001-T&R; Mouser Price/Stock: https://www.mouser.co.uk/ProductDetail/Acconeer/A121-001-TR?qs=amGC7iS6iy%2F9krRiPHmNkQ%3D%3D
J12 = 10144041-10011LF: MF: {'manufacturer': u'Amphenol ICC (FCI)'}; Package: None; Price: None; Value: *; MP: 10144041-10011LF; Availability: Unavailable
Y3 = ECS-240-8-36-RWN-TR3: MF: {'manufacturer': u'ECS Inc.'}; Package: None; Price: None; Value: *; MP: ECS-240-8-36-RWN-TR3; Availability: Unavailable

## Sheet battery check and motor.SchDoc
size A4; SheetNumber: 4; SheetTotal: 4
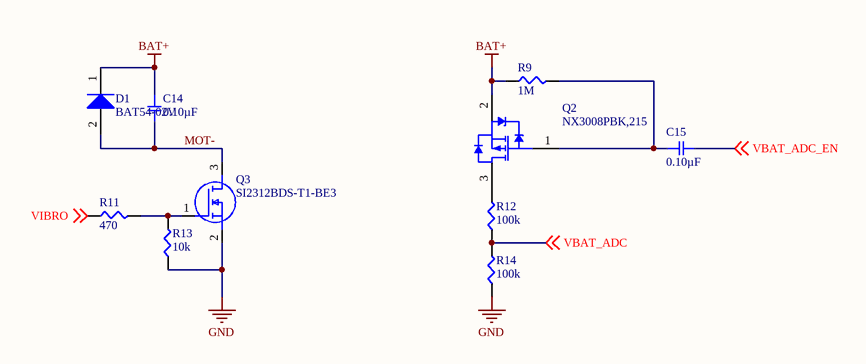
[diagram p3: battery check and motor.SchDoc]

### Parts
C14  0.10µF  [SMD-0402C]
C15  0.10µF  [SMD-0402C]
D1  BAT54-02V  [INF-SC79_V]
Q2  NX3008PBK,215  [NXP-SOT23_N]
Q3  SI2312BDS-T1-BE3  [SOT95P237X112-3N]
R9  1M  [SMD-0402-RES]
R11  470  [SMD-0402-RES]
R12  100k  [SMD-0402-RES]
R13  10k  [SMD-0402-RES]
R14  100k  [SMD-0402-RES]

### Nets
BAT+: C14.1 D1.1(K) Q2.2(S) R9.1
GND: Q3.2(S) R13.1 R14.1
MOT-: C14.2 D1.2(A) Q3.3(D)
VBAT_ADC: R12.1 R14.2 ; off-sheet VBAT_ADC
VBAT_ADC_EN: C15.2 ; off-sheet VBAT_ADC_EN
VIBRO: R11.1 ; off-sheet VIBRO
NetC15_1: C15.1 Q2.1(G) R9.2
NetQ2_3: Q2.3(D) R12.2
NetQ3_1: Q3.1(G) R11.2 R13.2

### Notes on the sheet
- Title:
- Project:
- Date:
- Time:
- Sheet
- Size:
- A4
- Of
- Designed By:
- File:
- Shourav.EEE015@gmail.com
- Shourav Sarkar
- Rev:

### Library data of the parts
C14 C15 = GCM155R71C104KA55D: as C16 on sheet main sch; Datasheets: http://www.murata.com/~/media/webrenewal/support/library/catalog/products/capacitor/mlcc/c03e.ashx; Image: //media.digikey.com/Renders/Murata%20Renders/ZRB-SERIES-0402.jpg; Digi-Key Part Number: 490-4759-1-ND; Part Number: GCM155R71C104KA55D; Quantity Available: 734194; @ qty: 0; Packaging: Cut Tape (CT); Series: GCM; Part Status: Active; Value: 0.10µF; Voltage: 16V; Temperature Coefficient: X7R; Operating Temperature: -55°C ~ 125°C; Features: -; Ratings: AEC-Q200; Applications: Automotive; Mounting Type: Surface Mount, MLCC; Package / Case: 0402 (1005 Metric); Size / Dimension: 0.039" L x 0.020" W (1.00mm x 0.50mm); Height - Seated (Max): -; Thickness (Max): 0.022" (0.55mm); Lead Spacing: -; Lead Style: -
D1 = CMP-1182-00001-1: Silicon Schottky Diode, SC79, Reel, Green; Manufacturer: Infineon; Green: TRUE; ComponentLink3Description: Package Specification; ComponentLink2Description: Datasheet; ComponentLink1Description: Manufacturer URL; PackageDescription: 2-Pin Semiconductor Package, 0.8 x 1.2 mm Body; RevisionNote: Re-Activated Devices; PartNumber: BAT54-02V; ComponentLink3URL: http://www.infineon.com/dgdl/SC79-Package_Overview.pdf?folderId=db3a30431936bc4b011951fbddb03b15&fileId=db3a30431936bc4b01195226fe583b41; PackageReference: SC79; ComponentLink1URL: http://www.infineon.com/; ComponentLink2URL: http://www.infineon.com/dgdl/bat54series.pdf?folderId=db3a30431400ef68011425f1ca2505e3&fileId=db3a304314dca3890115190b74210ea6; Mounting Technology: Surface Mount; Halogen-free: FALSE
Q2 = CMP-1259-00084-1: P-Channel Trench MOSFET, -30 V, -0.23 A, -55 to 150 degC, 3-Pin SOT23, Tape and Reel; Manufacturer: NXP Semiconductors; Channel Type: P; VGSth [typ] (V): -0.9; IDM [max] (A): -1; Packing: Tape & Reel; Automotive Qualified: Y; ComponentLink2Description: Datasheet; ID [max] (A): -0.23; PartNumber: NX3008PBK,215; ComponentLink3URL: http://www.nxp.com/documents/outline_drawing/sot023_po.pdf; VDS [max] (V): -30; ComponentLink2URL: http://www.nxp.com/documents/data_sheet/NX3008PBK.pdf; ComponentLink3Description: Package Specification; PackageReference: SOT23; PackageDescription: 3-Pin Small Outline Transistor Package, Body 2.9 x 1.3 mm, Pitch 0.95 mm; Mounting Technology: Surface Mount; ComponentLink1Description: Manufacturer URL; PackageVersion: 06-03-16, 03/2006; DatasheetVersion: Rev. 1; ComponentLink1URL: http://www.nxp.com/; Code_JEDEC: TO-236AB
Q3 = SI2312BDS-T1-BE3: MOSFET (N-Channel); Manufacturer_Name: Vishay; Datasheet Link: https://www.mouser.in/datasheet/2/427/VISH_S_A0010924773_1-2571514.pdf; Height: 1.12mm; Manufacturer_Part_Number: SI2312BDS-T1-BE3; Mouser Part Number: 78-SI2312BDS-T1-BE3; Mouser Price/Stock: https://www.mouser.co.uk/ProductDetail/Vishay-Siliconix/SI2312BDS-T1-BE3?qs=CiayqK2gdcLWl7ngxjbeYA%3D%3D; Arrow Part Number: SI2312BDS-T1-BE3; Arrow Price/Stock: https://www.arrow.com/en/products/si2312bds-t1-be3/vishay?region=nac
R9 = ERJ-2GEJ105X: RES SMD 1M OHM 5% 1/10W 0402; Manufacturer: Panasonic Electronic Components; Factory Stock: 0; Unit Price (USD): 0.00350; @ qty: 1500; Minimum Quantity: 1; Power (Watts): 0.1W, 1/10W; Temperature Coefficient: ±200ppm/°C; Part Number: ERJ-2GEJ105X; Datasheets: http://industrial.panasonic.com/www-cgi/jvcr13pz.cgi?E+PZ+3+AOA0001+ERJ2GEJ105X+7+WW; Image: //media.digikey.com/Photos/Panasonic%20Photos/ERJ-PA2-Series.jpg; Digi-Key Part Number: P1.0MJCT-ND; Quantity Available: 1082572; Packaging: Cut Tape (CT); Series: ERJ; Part Status: Active; Value: 1M; Tolerance: ±5%; Composition: Thick Film; Features: Automotive AEC-Q200; Operating Temperature: -55°C ~ 155°C; Package / Case: 0402 (1005 Metric); Supplier Device Package: 0402; Size / Dimension: 0.039" L x 0.020" W (1.00mm x 0.50mm); Height - Seated (Max): 0.016" (0.40mm); Number of Terminations: 2; Failure Rate: -
R11 = ERJ-2RKF4700X: RES SMD 470 OHM 1% 1/10W 0402; Manufacturer: Panasonic Electronic Components; Factory Stock: 0; Unit Price (USD): 0.00496; @ qty: 1500; Minimum Quantity: 1; Power (Watts): 0.1W, 1/10W; Temperature Coefficient: ±100ppm/°C; Part Number: ERJ-2RKF4700X; Datasheets: http://industrial.panasonic.com/www-cgi/jvcr13pz.cgi?E+PZ+3+AOA0002+ERJ2RKF4700X+7+WW; Image: //media.digikey.com/Photos/Panasonic%20Photos/ERJ-PA2-Series.jpg; Digi-Key Part Number: P470LCT-ND; Quantity Available: 52644; Packaging: Cut Tape (CT); Series: ERJ; Part Status: Active; Value: 470; Tolerance: ±1%; Composition: Thick Film; Features: Automotive AEC-Q200; Operating Temperature: -55°C ~ 155°C; Package / Case: 0402 (1005 Metric); Supplier Device Package: 0402; Size / Dimension: 0.039" L x 0.020" W (1.00mm x 0.50mm); Height - Seated (Max): 0.016" (0.40mm); Number of Terminations: 2; Failure Rate: -
R12 R14 = ERJ-2GEJ104X: as R10 on sheet main sch; Part Number: ERJ-2GEJ104X; Datasheets: http://industrial.panasonic.com/www-cgi/jvcr13pz.cgi?E+PZ+3+AOA0001+ERJ2GEJ104X+7+WW; Image: //media.digikey.com/Photos/Panasonic%20Photos/ERJ-PA2-Series.jpg; Digi-Key Part Number: P100KJCT-ND; Quantity Available: 2387986; Packaging: Cut Tape (CT); Series: ERJ; Part Status: Active; Value: 100k; Tolerance: ±5%; Composition: Thick Film; Features: Automotive AEC-Q200; Operating Temperature: -55°C ~ 155°C; Package / Case: 0402 (1005 Metric); Supplier Device Package: 0402; Size / Dimension: 0.039" L x 0.020" W (1.00mm x 0.50mm); Height - Seated (Max): 0.016" (0.40mm); Number of Terminations: 2; Failure Rate: -
R13 = ERJ-2GEJ103X: as R3 on sheet main sch; Part Number: ERJ-2GEJ103X; Datasheets: http://industrial.panasonic.com/www-cgi/jvcr13pz.cgi?E+PZ+3+AOA0001+ERJ2GEJ103X+7+WW; Image: //media.digikey.com/Photos/Panasonic%20Photos/ERJ-PA2-Series.jpg; Digi-Key Part Number: P10KJCT-ND; Quantity Available: 2560215; Packaging: Cut Tape (CT); Series: ERJ; Part Status: Active; Value: 10k; Tolerance: ±5%; Composition: Thick Film; Features: Automotive AEC-Q200; Operating Temperature: -55°C ~ 155°C; Package / Case: 0402 (1005 Metric); Supplier Device Package: 0402; Size / Dimension: 0.039" L x 0.020" W (1.00mm x 0.50mm); Height - Seated (Max): 0.016" (0.40mm); Number of Terminations: 2; Failure Rate: -

## Nets that join several sheets
3.3V: main sch (11 pins), power schematic (C7.1 L2.2 U3.4), radar sch (C5.1 IC3.J1 IC3.K9 J12.8)
+1.8V: power schematic (C4.1 L1.2 U2.4), radar sch (9 pins)
BAT+: power schematic (7 pins), battery check and motor (C14.1 D1.1 Q2.2 R9.1)
GND: main sch (24 pins), power schematic (14 pins), radar sch (45 pins), battery check and motor (Q3.2 R13.1 R14.1)
VUSB: main sch (J1.A4 J1.A9 J1.B4 J1.B9), power schematic (C1.1 R1.2 U1.4)
CHRG: main sch (IC2.41), power schematic (R1.1 U1.1)
EN_1.8V: main sch (IC2.10), power schematic (U2.3)
ENABLE_RADAR: main sch (IC2.21), radar sch (IC3.F10 J12.6)
INTERRUPT: main sch (IC2.39), radar sch (IC3.K8)
INTERRUPT 2: main sch (IC2.20), radar sch (J12.5)
SPI_CLK: main sch (IC2.15), radar sch (IC3.K2)
SPI_CLK2: main sch (IC2.26), radar sch (J12.2)
SPI_MISO: main sch (IC2.16), radar sch (IC3.K3)
SPI_MISO2: main sch (IC2.27), radar sch (J12.3)
SPI_MOSI: main sch (IC2.17), radar sch (IC3.K6)
SPI_MOSI2: main sch (IC2.28), radar sch (J12.4)
SPI_SS: main sch (IC2.18), radar sch (IC3.J2)
SPI_SS2: main sch (IC2.25), radar sch (J12.1)